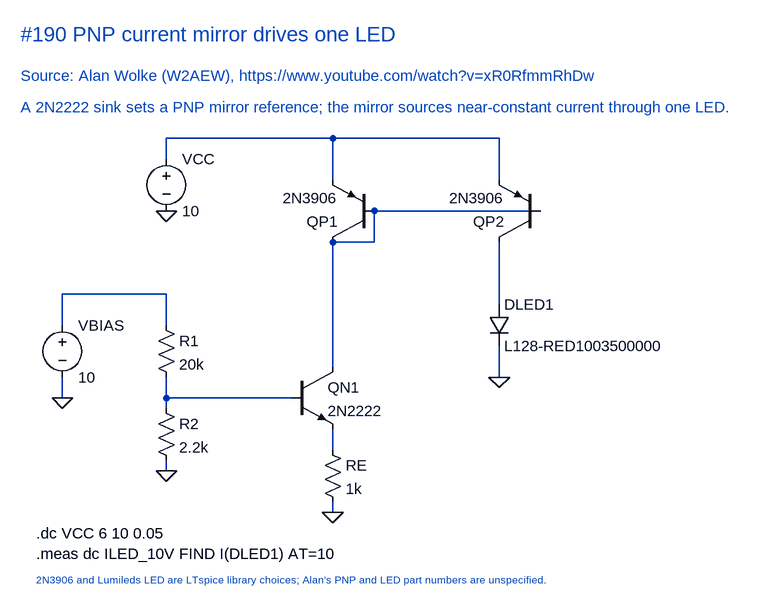
[diagram p0: schematic PNP mirror - one LED.asc]
PNP mirror - one LED.asc, the LTspice schematic file:
Version 4.1
SHEET 1 1244 1000
WIRE 528 16 272 16
WIRE 784 16 528 16
WIRE 272 48 272 16
WIRE 528 80 528 16
WIRE 784 80 784 16
WIRE 848 128 592 128
WIRE 592 176 592 128
WIRE 592 176 528 176
WIRE 272 256 112 256
WIRE 784 272 784 176
WIRE 112 304 112 256
WIRE 272 304 272 256
WIRE 528 368 528 176
WIRE 784 384 784 336
WIRE 112 416 112 384
WIRE 272 416 272 384
WIRE 464 416 272 416
WIRE 272 432 272 416
WIRE 528 496 528 464
WIRE 272 528 272 512
WIRE 528 592 528 576
FLAG 272 528 0
FLAG 528 592 0
FLAG 784 384 0
FLAG 272 128 0
FLAG 112 416 0
SYMBOL voltage 272 32 R0
SYMATTR InstName VCC
SYMATTR Value 10
SYMBOL voltage 112 288 R0
SYMATTR InstName VBIAS
SYMATTR Value 10
SYMBOL res 256 288 R0
SYMATTR InstName R1
SYMATTR Value 20k
SYMBOL res 256 416 R0
SYMATTR InstName R2
SYMATTR Value 2.2k
SYMBOL pnp 592 176 R180
SYMATTR InstName QP1
SYMATTR Value 2N3906
SYMBOL pnp 848 176 R180
SYMATTR InstName QP2
SYMATTR Value 2N3906
SYMBOL npn 464 368 R0
SYMATTR InstName QN1
SYMATTR Value 2N2222
SYMBOL res 512 480 R0
SYMATTR InstName RE
SYMATTR Value 1k
SYMBOL diode 768 272 R0
SYMATTR InstName DLED1
SYMATTR Value L128-RED1003500000
TEXT 48 -144 Left 3 ;#190 PNP current mirror drives one LED
TEXT 48 -80 Left 2 ;Source: Alan Wolke (W2AEW), https://www.youtube.com/watch?v=xR0RfmmRhDw
TEXT 48 -32 Left 2 ;A 2N2222 sink sets a PNP mirror reference; the mirror sources near-constant current through one LED.
TEXT 72 624 Left 2 !.dc VCC 6 10 0.05
TEXT 72 656 Left 2 !.meas dc ILED_10V FIND I(DLED1) AT=10
TEXT 72 696 Left 1 ;2N3906 and Lumileds LED are LTspice library choices; Alan's PNP and LED part numbers are unspecified.

The netlist it stands for:
* PNP mirror - one LED.asc
VCC N001 0 10
VBIAS N003 0 10
R1 N003 N005 20k
R2 N005 0 2.2k
QP1 N002 N002 N001 0 2N3906
QP2 N004 N002 N001 0 2N3906
QN1 N002 N005 N006 0 2N2222
RE N006 0 1k
DLED1 N004 0 L128-RED1003500000
.model D D
.lib standard.dio
.model NPN NPN
.model PNP PNP
.lib standard.bjt
* #190 PNP current mirror drives one LED
* Source: Alan Wolke (W2AEW), https://www.youtube.com/watch?v=xR0RfmmRhDw
* A 2N2222 sink sets a PNP mirror reference; the mirror sources near-constant current through one LED.
.dc VCC 6 10 0.05
.meas dc ILED_10V FIND I(DLED1) AT=10
* 2N3906 and Lumileds LED are LTspice library choices; Alan's PNP and LED part numbers are unspecified.
.backanno
.end